# Altium schematic sheet Vref.SchDoc
size A4; SheetNumber: 2; SheetTotal: 5
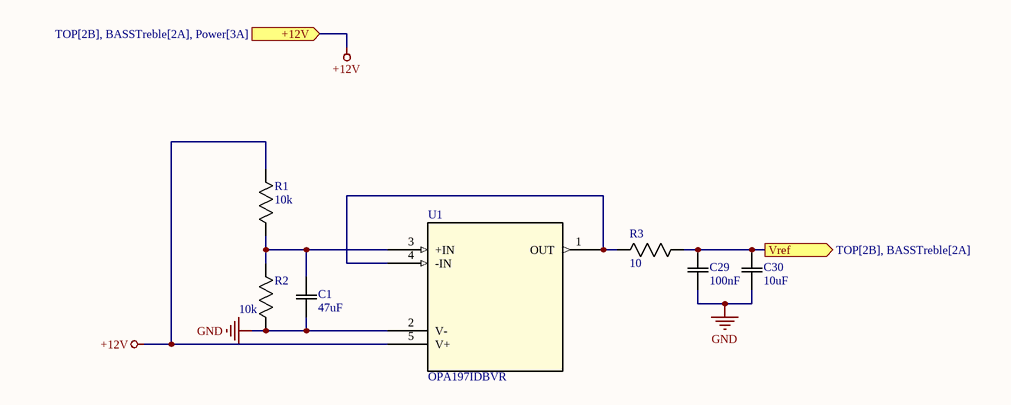
[diagram p0: Vref.SchDoc]

## Parts
C1  47uF  [1210 CAP]
C29  100nF  [0603 Cap - C0G]
C30  10uF  [0805 CAP - C0G]
R1  10k  [0603 RES]
R2  10k  [0603 RES]
R3  10  [0805 RES]
U1  OPA197IDBVR  [OPA197IDBVR]

## Ports
+12V (in, see TOP[2B], BASSTreble[2A], Power[3A]), Vref (out, see TOP[2B], BASSTreble[2A])

## Nets
+12V: R1.1 U1.5(V+) ; port +12V
GND: C1.1 C29.2 C30.1 R2.2 U1.2(V-)
Vref: C29.1 C30.2 R3.1 ; port Vref
NetC1_2: C1.2 R1.2 R2.1 U1.3(+IN)
NetR3_2: R3.2 U1.1(OUT) U1.4(-IN)

## Library data of the parts
C1 C29 C30 = CAP_CERAMIC: Manufacturer_Name: Kemet; Manufacturer_Part_Number: C0603C104K5RACTU; Copyright: Copyright (C) 2026 Ultra Librarian. All rights reserved.
R1-R3 = Resistor: Manufacturer_Name: Vishay; Manufacturer_Part_Number: CRCW060310K0FKEA; Copyright: Copyright (C) 2025 Ultra Librarian. All rights reserved.
U1 = OPA197IDBVR: Single, 36-V, precision, rail-to-rail input output, low offset voltage op amp 5-SOT-23 -40 to 125; Manufacturer_Name: Texas Instruments; Copyright: Copyright (C) 2026 Ultra Librarian. All rights reserved.; Manufacturer_Part_Number: OPA197IDBVR; RefDes: RefDes; Type: Type